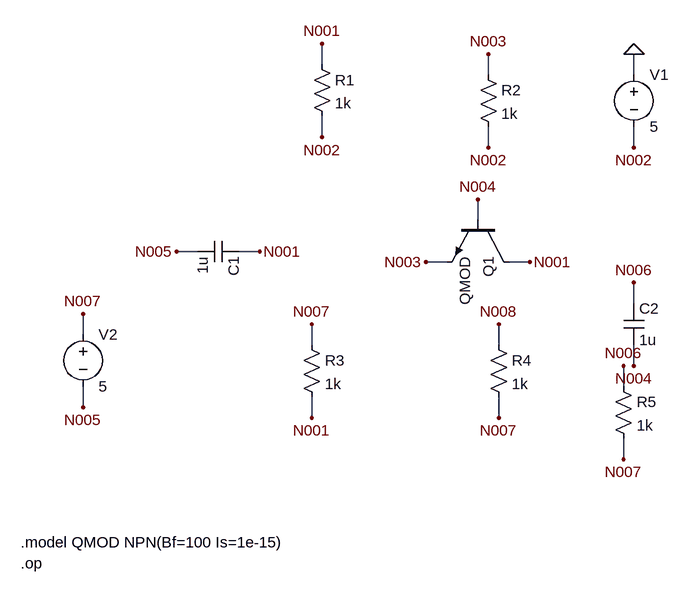
[diagram p0: schematic C2_D1_P1.asc]
C2_D1_P1.asc, the LTspice schematic file:
Version 4
SHEET 1 1328 976
WIRE 1008 96 1008 64
WIRE 528 80 528 48
WIRE 816 384 848 384
WIRE 400 368 432 368
WIRE 512 592 512 624
WIRE 528 160 528 192
WIRE 1008 176 1008 208
WIRE 784 176 784 208
WIRE 784 96 784 64
WIRE 720 384 688 384
WIRE 768 320 768 288
WIRE 1008 512 1008 544
WIRE 336 368 304 368
WIRE 160 576 160 608
WIRE 1008 448 1008 416
WIRE 992 576 992 544
WIRE 160 496 160 464
WIRE 512 512 512 480
WIRE 800 592 800 624
WIRE 992 656 992 688
WIRE 800 512 800 480
FLAG 1008 64 0
FLAG 528 48 N001
FLAG 848 384 N001
FLAG 432 368 N001
FLAG 512 624 N001
FLAG 528 192 N002
FLAG 1008 208 N002
FLAG 784 208 N002
FLAG 784 64 N003
FLAG 688 384 N003
FLAG 768 288 N004
FLAG 1008 544 N004
FLAG 304 368 N005
FLAG 160 608 N005
FLAG 1008 416 N006
FLAG 992 544 N006
FLAG 160 464 N007
FLAG 512 480 N007
FLAG 800 624 N007
FLAG 992 688 N007
FLAG 800 480 N008
SYMBOL res 512 64 R0
SYMATTR InstName R1
SYMATTR Value 1k
SYMBOL voltage 1008 80 R0
SYMATTR InstName V1
SYMATTR Value 5
SYMBOL res 768 80 R0
SYMATTR InstName R2
SYMATTR Value 1k
SYMBOL npn 816 320 R90
SYMATTR InstName Q1
SYMATTR Value QMOD
SYMBOL cap 400 352 R90
SYMATTR InstName C1
SYMATTR Value 1u
SYMBOL cap 992 448 R0
SYMATTR InstName C2
SYMATTR Value 1u
SYMBOL voltage 160 480 R0
SYMATTR InstName V2
SYMATTR Value 5
SYMBOL res 496 496 R0
SYMATTR InstName R3
SYMATTR Value 1k
SYMBOL res 784 496 R0
SYMATTR InstName R4
SYMATTR Value 1k
SYMBOL res 976 560 R0
SYMATTR InstName R5
SYMATTR Value 1k
TEXT 64 816 Left 2 !.model QMOD NPN(Bf=100 Is=1e-15)
TEXT 64 848 Left 2 !.op

The netlist it stands for:
* C2_D1_P1.asc
R1 N001 N002 1k
V1 0 N002 5
R2 N003 N002 1k
Q1 N001 N004 N003 0 QMOD
C1 N001 N005 1u
C2 N006 N004 1u
V2 N007 N005 5
R3 N007 N001 1k
R4 N008 N007 1k
R5 N006 N007 1k
.model NPN NPN
.model PNP PNP
.lib standard.bjt
.model QMOD NPN(Bf=100 Is=1e-15)
.op
.backanno
.end